# EAGLE design source_eagle (EAGLE 6.4)
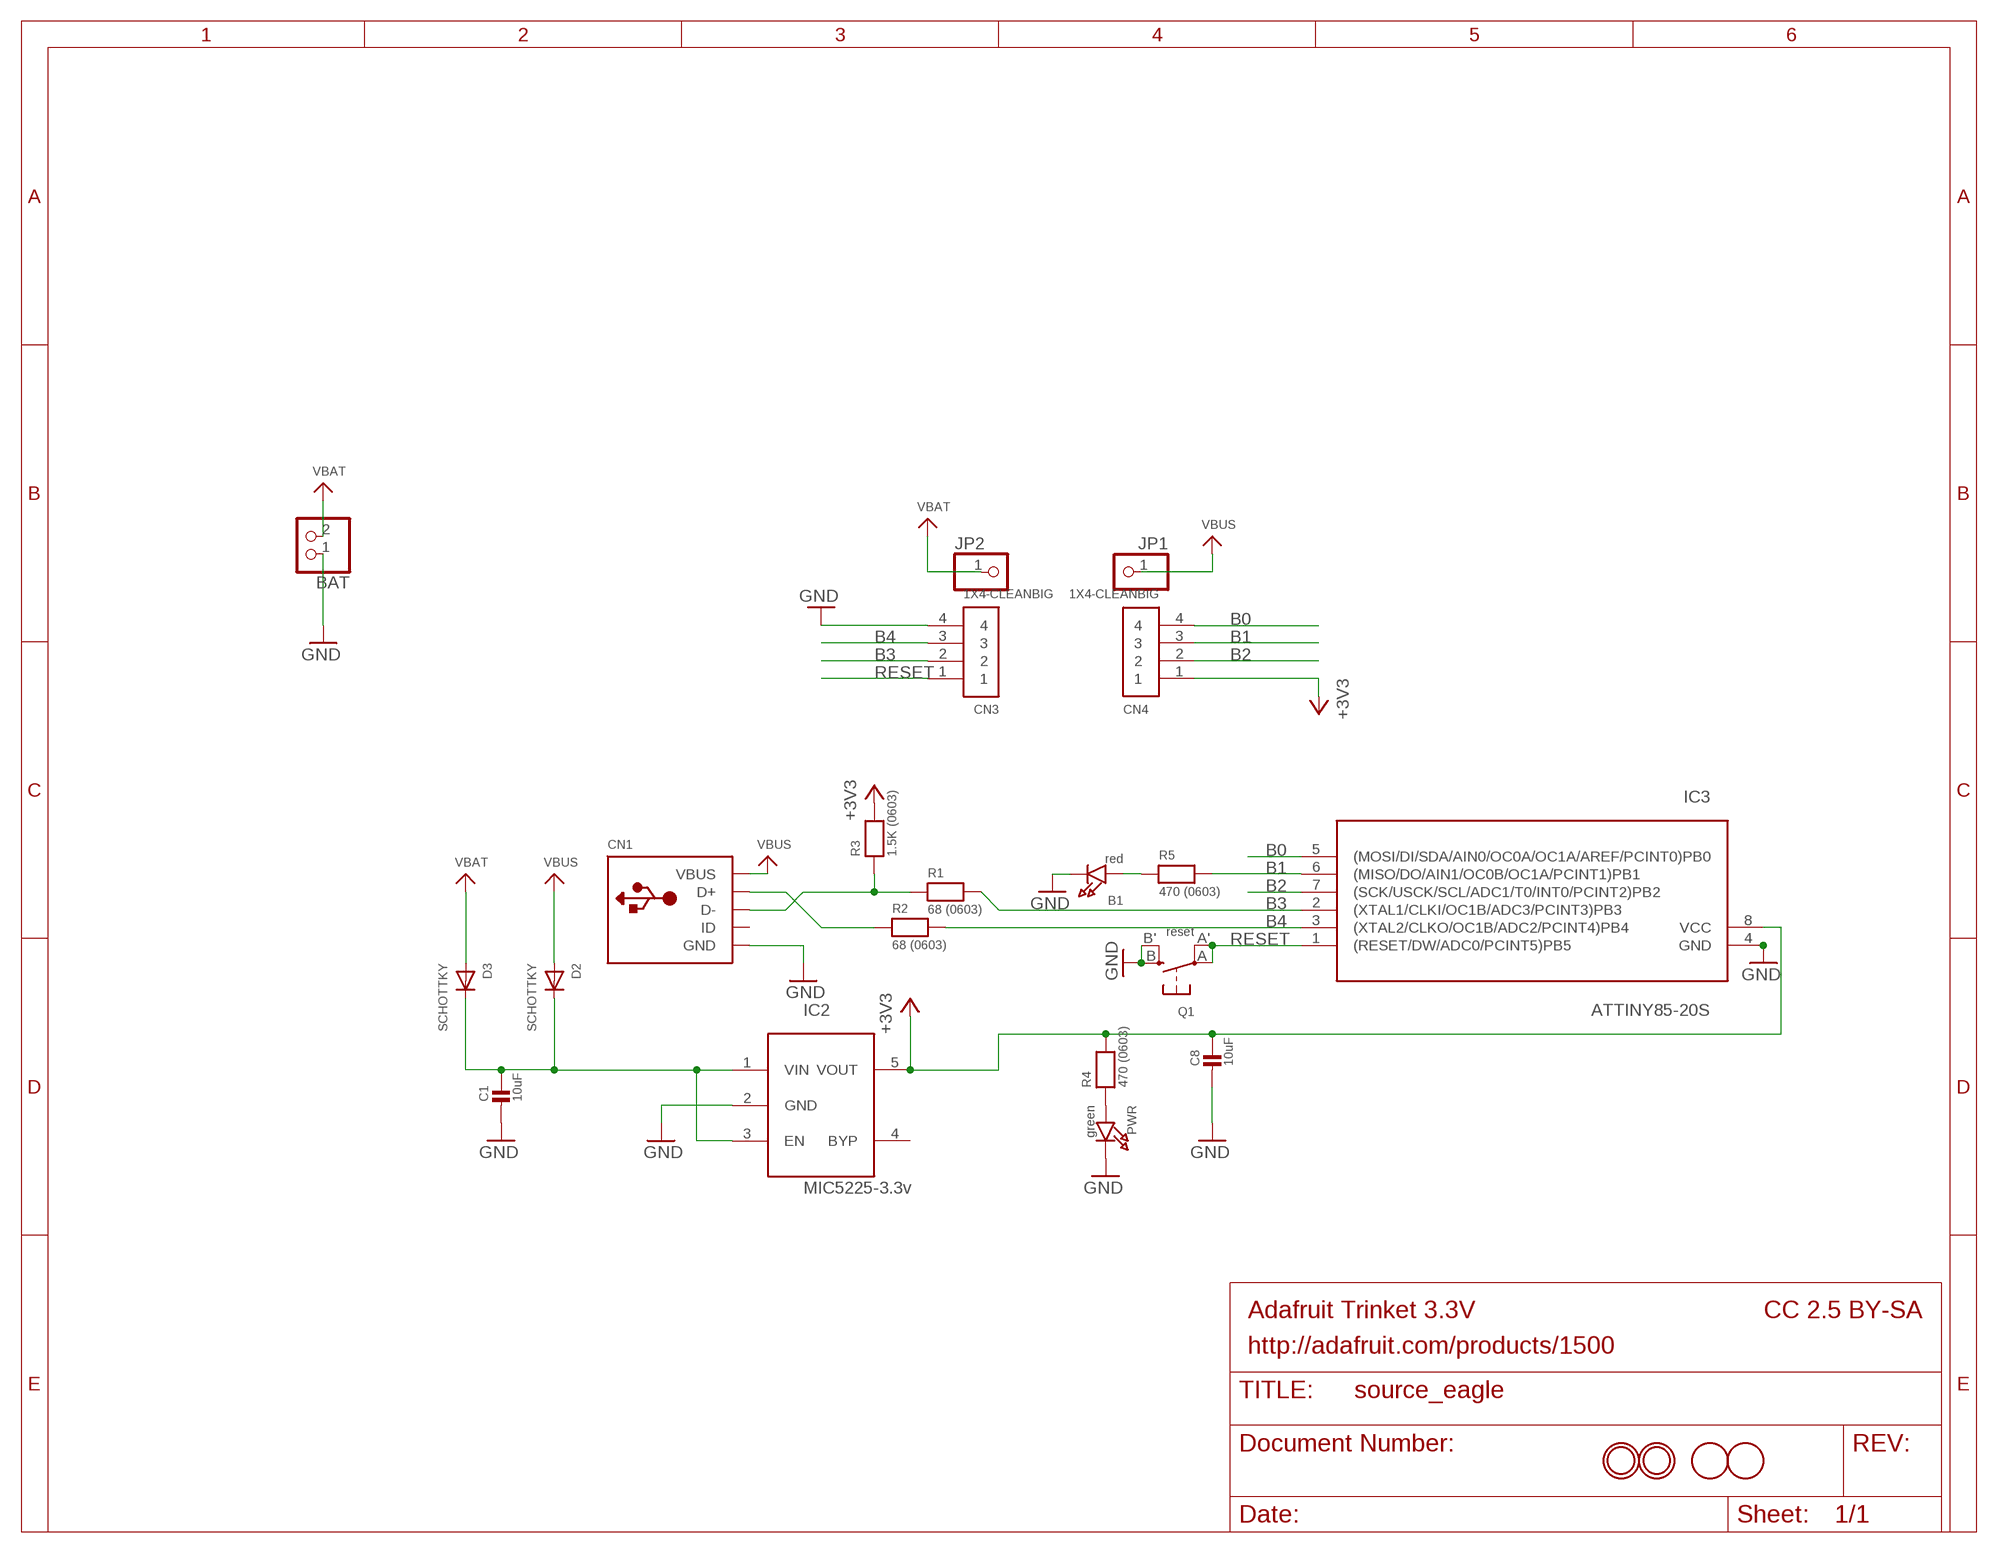
[diagram p0: schematic, sheet 1]

## Parts
B1  red  LED0805_NOOUTLINE  [CHIPLED_0805_NOOUTLINE]
BAT  CON_JST_PH_2PIN  [JSTPH2]
C1  10uF  CAP_CERAMIC0805-NOOUTLINE  [0805-NO]
C8  10uF  CAP_CERAMIC0805-NOOUTLINE  [0805-NO]
CN1  USBMINIB  [USB-MINIB]
CN3  1X4-CLEANBIG  [1X04-CLEANBIG]
CN4  1X4-CLEANBIG  [1X04-CLEANBIG]
D2  SCHOTTKY  DIODE_SOD-123FL  [SOD-123FL]
D3  SCHOTTKY  DIODE_SOD-123FL  [SOD-123FL]
IC2  MIC5225-3.3v  LP298XS  [SOT23-5L]
IC3  ATTINY85-20S  ATTINY85V-10S  [SOIC8]
JP1  PINHD-1X1CB  [1X01-CLEANBIG]
JP2  PINHD-1X1CB  [1X01-CLEANBIG]
PWR  green  LED0805_NOOUTLINE  [CHIPLED_0805_NOOUTLINE]
Q1  reset  SWITCH_TACT_SMT4.6X2.8  [BTN_KMR2_4.6X2.8]
R1  68 (0603)  RESISTOR_0603_NOOUT  [0603-NO]
R2  68 (0603)  RESISTOR_0603_NOOUT  [0603-NO]
R3  1.5K (0603)  RESISTOR_0603_NOOUT  [0603-NO]
R4  470 (0603)  RESISTOR_0603_NOOUT  [0603-NO]
R5  470 (0603)  RESISTOR_0603_NOOUT  [0603-NO]
U$1  FIDUCIAL  [FIDUCIAL_1MM]
U$6  FIDUCIAL  [FIDUCIAL_1MM]
U$8  MOUNTINGHOLE2.0  [MOUNTINGHOLE_2.0_PLATED]
U$9  MOUNTINGHOLE2.0  [MOUNTINGHOLE_2.0_PLATED]

## Nets
+3V3: C8.1 CN4.1 IC2.5(VOUT) IC3.8(VCC) R3.2 R4.2
B0: CN4.4 IC3.5((MOSI/DI/SDA/AIN0/OC0A/OC1A/AREF/PCINT0)PB0)
B1: CN4.3 IC3.6((MISO/DO/AIN1/OC0B/OC1A/PCINT1)PB1) R5.2
B2: CN4.2 IC3.7((SCK/USCK/SCL/ADC1/T0/INT0/PCINT2)PB2)
B3: CN3.2 IC3.2((XTAL1/CLKI/OC1B/ADC3/PCINT3)PB3) R1.2
B4: CN3.3 IC3.3((XTAL2/CLKO/OC1B/ADC2/PCINT4)PB4) R2.2
D+: CN1.D+ R2.1
D-: CN1.D- R1.1 R3.1
GND: B1.C BAT.1 C1.2 C8.2 CN1.GND CN1.GND1(GND) CN1.GND2(GND) CN1.GND3(GND) CN1.GND4(GND) CN3.4 IC2.2(GND) IC3.4(GND) PWR.C Q1.B'(S1) Q1.B(S)
N$1: B1.A R5.1
N$6: PWR.A R4.1
N$7: C1.1 D2.C D3.C IC2.1(VIN) IC2.3(EN)
RESET: CN3.1 IC3.1((RESET/DW/ADC0/PCINT5)PB5) Q1.A'(P1) Q1.A(P)
VBAT: BAT.2 D3.A JP2.1
VBUS: CN1.VBUS D2.A JP1.1
Unconnected: CN1.ID IC2.4(BYP)

## Notes on the sheet
- Adafruit Trinket 3.3V | CC 2.5 BY-SA
- http://adafruit.com/products/1500

## Library data of the parts
B1 PWR = microbuilder:LED: LED 0603 - 0603 Surface Mount Package 2mA: Green LED - Low Power (3.9mcd, 2ma, 1.7Vf) - Digikey: 475-2709-2-ND Orange LED - Low Power (9.8mcd, 2ma, 1.8Vf) - Digikey: 475-1194-2-ND Red LED - Low Power (5mcd, 2ma, 1.8Vf) - Digikey: 475-1195-2-ND Yellow LED - Low Power (7mcd, 2ma, 1.8Vf) - Digikey: 475-1196-2-ND 5mA: Blue LED - Low Power (17mcd, 5ma, 2.9Vf) - Digikey: LNJ937W8CRACT-ND 0805 - 0805 Surface Mount Package 2mA: Red LED (8.8mcd, 2mA, 1.8Vf, Clear) - Low Power [Digikey: 475-2510-1-ND] Green LED (5mcd, 2mA, 1.8Vf, Clear) - Low Power [Digikey: 475-2730-1-ND] Yellow LED (11.3mcd, 2mA, 1.8Vf, Clear) - Low Power [Digikey: 475-2555-1-ND] 20mA: Red LED (104mcd, 20mA, Diffused) - LS R976 [Digikey: 475-1278-6-ND] Red LED (12mcd, 20mA, 2.0Vf, Clear) - APT2012EC [Digikey: 754-1128-1-ND] Green LED (15mcd, 20mA, 2.2Vf, Clear) - APT2012GC [Digikey: 754-1131-1-ND] Orange LED (160mcd, 20mA, 2.1Vf, Clear) - APT2012SECK [Digikey: 754-1130-1-ND] 1206 - 1206 Surface Mount Package Green LED (26mcd, 20mA, Diffused) - LG N971 [Digikey: 475-1407-6-ND] Red LED (15mcd, 20mA, Diffused) - LH N974 [Digikey: 475-1416-6-ND] Cree - Cree High-Power Surface Mount LEDs XPEBWT-L1-0000-00D50 - White 111lm 350mA 2.9Vf 6200K 110° XTEAWT-00-0000-00000LEE3 - White 114lm 350mA 2.85Vf 5000K 115° Everlight - Everlight 45-21 Series Surface Mount LEDs 45-21/QK2C-B2832AC2CB2/2T - Warm White 2000mcd 20mA 3.25Vf 3050K 120° 45-21/LK2C-B38452C4CB2/2T - Nuetral White 2000mcd 20mA 3.25Vf 4150K 120° 45-21/LK2C-B50634C6CB2/2T - Cold White 2200mcd 20mA 3.25Vf 5650K 120° PLCC2 Reverse Mount LS T77K-J1L2-1-0-2-R18-Z - Red 11.25mcd 2mA 1.8Vf 630nm 120° LO T77K-L1M2-24-Z - Orange 19.6mcd 2mA 1.8Vf 606nm 120° LY T77K-K2M1-26-Z - Yellow 15.7mcd 2mA 1.8Vf 587nm 120°
BAT = microbuilder:CON_JST_PH_2PIN: JST 2-Pin Right-Angle Connector PH-Series - 4UConnector: 17311 SH-Series - 4UConnector: 07278
C1 C8 = microbuilder:CAP_CERAMIC: Ceramic Capacitors For new designs, use the packages preceded by an '_' character since they are more reliable: The following footprints should be used on most boards: _0402 - Standard footprint for regular board layouts _0603 - Standard footprint for regular board layouts _0805 - Standard footprint for regular board layouts For extremely tight-pitch boards where space is at a premium, the following 'micro-pitch' footprints can be used (smaller pads, no silkscreen outline, etc.): _0402MP - Micro-pitch footprint for very dense/compact boards _0603MP - Micro-pitch footprint for very dense/compact boards _0805MP - Micro-pitch footprint for very dense/compact boards Commonly Stocked Parts 0402 - 0402 Surface Mount Capacitors 16pF 50V 5% [Digikey: 445-4899-2-ND] 18pF 50V 5% [Digikey: 490-1281-2-ND] 22pF 50V 5% [Digikey: 490-1283-2-ND] 68pF 50V 5% [Digikey: 490-1289-2-ND] 0.1uF 10V 10% [Digikey: 490-1318-2-ND] 1.0uF 6.3V 10% [Digikey: 490-1320-2-ND] 0603 - 0603 Surface Mount Capacitors 16 pF 50V 5% [Digikey: 445-5051-2-ND] 22 pF 50V [Digikey: PCC220ACVTR-ND] 33 pF 50V 5% [Digikey: 490-1415-1-ND] 56pF 50V 5% [Digikey: 490-1421-1-ND] 220pF 50V 5% [Digikey: 445-1285-1-ND] 680 pF 50V 2200 pF 50V 5% C0G [Digikey: 445-1297-1-ND] 5600 pF 100V 5% X7R [Digikey: 478-3711-1-ND] 0.1 µF 25V 10% [Digikey: PCC2277TR-ND] 0.22 µF 16V 10% X7R [Digikey: 445-1318-1-ND] 1.0 µF 25V 10% [Digikey: 445-5146-2-ND] 0603 - RF Specific 3pF 250V +/-0.1pF RF [Digikey: 712-1347-1-ND] 18 pF 250V 5% [Digikey: 478-3505-1-ND or 712-1322-1-ND] 56 pF 250V 5% C0G RF [Digikey: 490-4867-1-ND] 68 pF 250V RF [Digikey: 490-4868-1-ND] 0805 - 0805 Surface Mount Capacitors 220 pF 250V 2% RF Ceramic Capacitor [Digikey: 712-1398-1-ND] 1000 pF 50V 2% NP0 Ceramic Capacitor [Digikey: 478-3760-1-ND] 0.1 µF 25V 10% Ceramic Capacitor [Digikey: PCC1828TR-ND] 1.0 µF 16V 10% Ceramic Capacitor[Digikey: 490-1691-2-ND] 10.0 µF 10V 10% Ceramic Capacitor[Digikey: 709-1228-1-ND] 10.0 uF 16V 10% Ceramic Capacitor [Digikey: 478-5165-2-ND] 47 uF 6.3V 20% Ceramic Capacitor [Digikey: 587-1779-1-ND or 399-5506-1-ND] 1206 - 1206 Surface Mount Capacitors 47uF 10V 20% Ceramic Capacitor [Digikey: 490-5528-1-ND or 399-5508-1-ND or 445-6010-1-ND] 100uF 6.3V -20%, +80% Y5V Ceramic Capacitor (Digikey: 490-4512-1-ND, Mouser: 81-GRM31CF50J107ZE1L)
CN1 = microbuilder:USB: USB Connectors USBMINIB - Surface Mount Female Mini-B USB Connector 4UConnector: 06564
CN3 CN4 = adafruit:1X4: 4-pin connector
D2 D3 = adafruit:DIODE: Diode SMADIODE - SMA Surface Mount Package 20V 1A Schottky Diode Digikey: 641-1014-6-ND DO-1N4148 - Through Hole Small Current Diode SOD-123 20V 1 A (.5mV Vf) Schottky Diode - Digikey: MBRX120TPMSCT-ND SOD-323 10V 570mA (.38mV Vf, 3ns) Schottky Diode - Digikey: ZLLS410CT-ND SOD-523 30V 30mA Schottky Diode (RB751S-40TE61) - Digikey: RB751S-40TE61CT-ND SOT23-R/W - SOT23 Package (R = Solder Paste/Reflow Ovens, W = Hand-Soldering) BAT54Film 40V 300mA - Digikey: 497-7162-1-ND
IC2 = adafruit:LP298X
IC3 = avr:ATTINY85: MICROCONTROLLER 8 Kbytes FLASH 512 bytes EEPROM 512 bytes RAM 4-channel 10 bit ADC USI
JP1 JP2 = adafruit:PINHD-1X1: Pin header 1x1 for 0.1" spacing With round pins
Q1 = microbuilder:SWITCH_TACT_SMT: SMT Tact Switches 6x6mm - Digikey: P12940SCT-ND KMR2 (4.6x2.8mm) - Digikey: 401-1426-1-ND EVQ-PQHB55 - Light Touch, 160GF (4.5x4.5mm) - Digikey: P8090SCT-ND KMT0 - KMT021 NGJ LHS (etc.) IP68/Waterproof - Digikey: CKN10289CT-ND
R1-R5 = microbuilder:RESISTOR: Resistors For new designs, use the packages preceded by an '_' character since they are more reliable: The following footprints should be used on most boards: _0402 - Standard footprint for regular board layouts _0603 - Standard footprint for regular board layouts _0805 - Standard footprint for regular board layouts For extremely tight-pitch boards where space is at a premium, the following 'micro-pitch' footprints can be used (smaller pads, no silkscreen outline, etc.): _0402MP - Micro-pitch footprint for very dense/compact boards _0603MP - Micro-pitch footprint for very dense/compact boards _0805MP - Micro-pitch footprint for very dense/compact boards
U$1 U$6 = adafruit:FIDUCIAL: For use by pick and place machines to calibrate the vision/machine, 1mm By microbuilder.eu
U$8 U$9 = microbuilder:MOUNTINGHOLE: Mounting Hole For #2 screws (0.086"/2.18mm width, 0.094"/2.4mm hole) use 2.5mm; BOM: EXCLUDE

## Net classes
1 power: width 0.305 mm

## Board
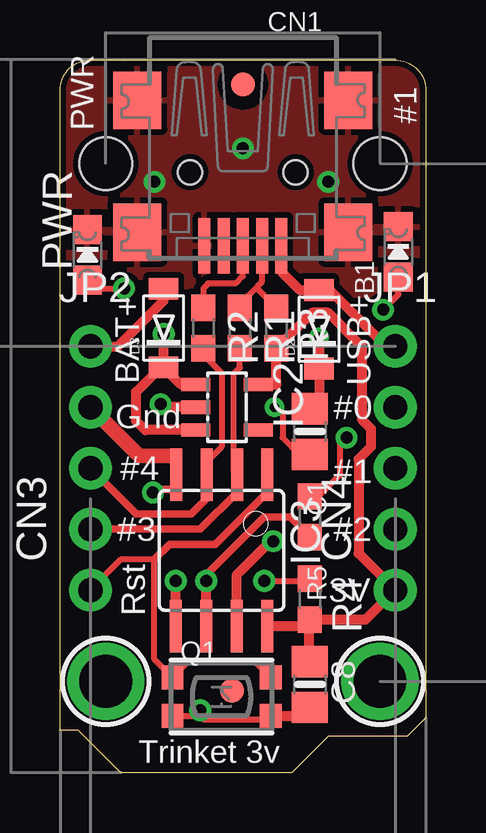
[diagram p1: board, top side]
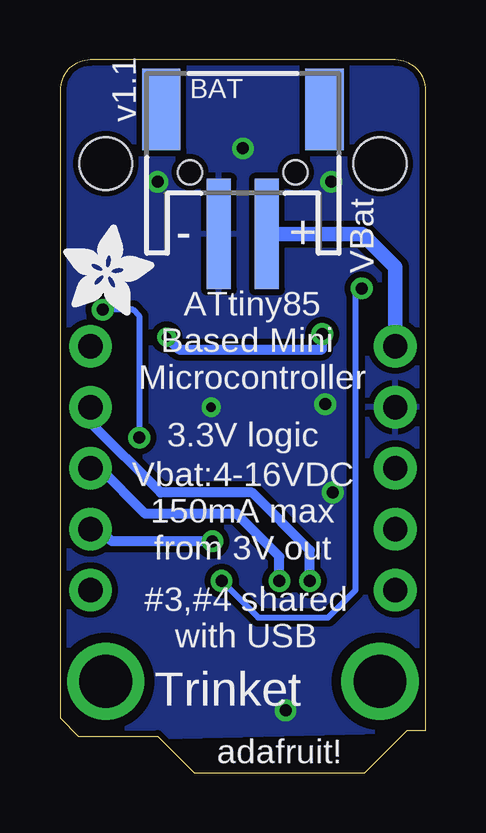
[diagram p2: board, bottom side, seen from below]

Size 15.24 x 29.72 mm. Coordinates in mm from the lower left corner, seen from the top.
Outline: 15.24,28.45 15.24,2.29 14.48,1.52 11.18,1.52 9.65,0 2.54,0 0.76,1.78 0,1.78 0,28.45 arc-90 1.27,29.72 13.97,29.72 arc-90 15.24,28.45
Copper layers (1*16): Top 0.035mm / dielectric 1.5mm / Bottom 0.035mm
Design rules "adafruit *": minimum track width 8mil, minimum drill 15.5mil, track to track 10mil, track to pad 10mil, pad to pad 10mil, via to via 10mil, smd to smd 8mil, copper to edge 10mil, drill to drill 8mil, minimum pad ring 10mil, minimum via ring 8mil, stop-mask expansion 4mil, vias tented up to drill 20mil, thermal gap 10mil
Holes 2.2 mm at 1.91,25.4 13.34,25.4

### Footprints (pad centres in the part's own frame; a part is rotated, then mirrored left to right if it is on the bottom)
CHIPLED_0805_NOOUTLINE = smd 1.2 x 1.2: A 0,-1.05; C 0,1.05
JSTPH2 = smd 1 x 4.6: 1 -1,-3.7; 2 1,-3.7 | smd 1.6 x 3.4: NC1 -3.4,1.5; NC2 3.4,1.5
0805-NO = smd 1.3 x 1.5: 1 -0.95,0; 2 0.95,0
USB-MINIB = smd 0.5 x 2.308: D+ 0,4.064; D- -0.8,4.064; GND 1.6,4.064; ID 0.8,4.064; VBUS -1.6,4.064 | smd 2 x 2.4: GND1 -4.4,-2; GND2 -4.4,3.5; GND3 4.4,3.5; GND4 4.4,-2 | hole 1: -2.2,1; 2.2,1
1X04-CLEANBIG = drill 1.016 pad 1.778: 1 -3.81,0; 2 -1.27,0; 3 1.27,0; 4 3.81,0
SOD-123FL = smd 0.91 x 1.22: A 1.637,0; C -1.637,0
SOT23-5L = smd 0.55 x 1.2: 1 -0.95,-1.3; 2 0,-1.3; 3 0.95,-1.3; 4 0.95,1.3; 5 -0.95,1.3
SOIC8 = smd 0.5 x 2.2: 1 -1.905,-3.154; 2 -0.645,-3.154; 3 0.625,-3.154; 4 1.895,-3.154; 5 1.905,3.154; 6 0.635,3.154; 7 -0.635,3.154; 8 -1.905,3.154
1X01-CLEANBIG = drill 1.016 pad 1.778: 1 0,0
BTN_KMR2_4.6X2.8 = smd 0.9 x 1: A 2.05,0.8; A' -2.05,0.8; B 2.05,-0.8; B' -2.05,-0.8
0603-NO = smd 1.1 x 1: 1 -0.85,0; 2 0.85,0
FIDUCIAL_1MM = smd 1 x 1: 1 0,0
MOUNTINGHOLE_2.0_PLATED = drill 2.2 pad 3: P$1 0,0

### Placement (x,y rotation side)
B1  14.1,21.72 0 top
BAT  7.62,26.16 0 bottom
C1  10.41,14.22 270 top
C8  10.41,3.68 270 top
CN1  7.62,26.04 180 top
CN3  1.27,11.43 90 top
CN4  13.97,11.43 90 top
D2  10.79,18.49 90 top
D3  4.32,18.54 90 top
IC2  6.96,15.24 270 top
IC3  6.73,9.27 180 top
JP1  13.97,17.78 0 top
JP2  1.27,17.78 0 top
PWR  1.14,21.59 0 top
Q1  6.73,3.18 0 top
R1  7.49,18.54 270 top
R2  5.97,18.54 270 top
R3  9.02,18.54 270 top
R4  10.41,7.24 270 top
R5  10.41,10.67 270 top
U$1  7.62,28.7 0 top
U$5  [ADAFRUIT_3.5MM]  15.11,19.05 0 bottom
U$6  7.18,3.43 0 top
U$8  1.91,3.81 0 top
U$9  13.34,3.81 0 top

### Tracks (layer width: path | path; a pad name or v marks a point on that pad's centre or on a via)
+3V3
  Top 0.254: 10.37,6.12 10.41,6.16 R4.2
  Top 0.406: IC3.8 10.37,6.12 10.37,4.68 C8.1 | IC2.5 9.02,16.19 R3.2 10.5,19.18 11.18,19.18 12.57,17.78 12.57,14.73 12.95,14.35 12.95,13.59 12.45,13.08 12.45,9.14 CN4.1 12.74,6.39 R4.2
B0  (via drill 0.5)
  Top 0.406: IC3.5 v4.83,8
  Bottom 0.406: v4.83,8 4.83,9.27 7.24,11.68 11.05,11.68 13.97,14.61 CN4.4 13.97,15.11
B1  (via drill 0.5)
  Top 0.305: v6.1,8 6.1,8.26 8.51,10.67 9.59,10.67 10.41,9.85 R5.2
  Top 0.406: IC3.6 v6.1,8
  Bottom 0.406: v6.1,8 6.1,9.02 7.87,10.8 11.68,10.8 13.59,12.7 CN4.3
B2  (via drill 0.5)
  Top 0.406: IC3.7 7.37,8.26 8.76,9.65 v8.89,9.65
  Bottom 0.406: v8.89,9.65 13.08,9.65 13.59,10.16 CN4.2
B3
  Top 0.254: 7.38,11.69 IC3.2 7.24,12.56 7.24,16.64 7.49,16.89 R1.2
  Top 0.305: 7.38,11.69 5.84,10.16 CN3.2
B4
  Top 0.254: R2.2 5.97,17.44 6.73,16.68 6.73,13.59 6.11,12.96 IC3.3
  Top 0.305: IC3.3 6.11,11.44 5.46,10.8 3.17,10.8 CN3.3
D+
  Top 0.254: R2.1 5.97,20.19 6.17,20.4 7.32,20.4 7.62,20.7 CN1.D+
D-
  Top 0.254: 8.26,20.32 8.42,20.48 CN1.D- | 8.26,20.32 7.49,19.56 R1.1 | R3.1 8.26,20.15 8.26,20.32
GND  (via drill 0.39, 0.5)
  Top 0.254: Q1.B' 5.84,2.38 | 5.84,2.38 6,2.22 8.64,2.22 8.64,2.23 Q1.B | v5.84,2.6 5.84,2.38 | v8.94,15.24 9.27,14.91 9.27,13.97 9.97,13.27 C1.2
  Top 0.305: 4.84,12.18 IC3.4 4.84,13.07 4.7,13.21 | 4.84,11.82 4.01,11.82 v3.87,11.68
  Top 0.406: Q1.B 10.06,2.38 C8.2 | 4.84,12.18 4.84,11.82 | IC2.2 4.32,15.24 v4.19,15.37
  Top 0.61: CN3.4 3.3,13.21 4.7,13.21
  other vias: 3.94,24.64 11.18,24.64 7.62,26.04
  pour Bottom: -0.25,29.84 0,1.78 15.24,1.4 14.99,29.46
  pour Top: 0.25,29.84 0.25,19.94 15.11,19.94 15.11,29.84
N$1  (via drill 0.5)
  Top 0.254: v11.94,13.97 11.68,13.72 11.68,12.45 10.76,11.52 R5.1 | B1.A 14.1,19.94 v13.46,19.3
  Bottom 0.254: v11.94,13.97 11.94,19.05 12.19,19.3 v13.46,19.3
N$6  (via drill 0.5)
  Top 0.254: PWR.A 1.18,20.54 1.52,20.19 v2.67,20.19 | v8.51,8 10.33,8 R4.1
  Bottom 0.254: v8.51,8 6.99,6.48 4.06,6.48 2.92,7.62 2.92,19.94 v2.67,20.19
N$7  (via drill 0.39, 0.5)
  Top 0.406: IC2.3 3.56,14.29 3.17,14.67 3.17,15.88 4.2,16.9 D3.C | C1.1 10.79,15.55 D2.C v10.79,18.16 | IC2.1 5.03,16.19 D3.C | D3.C v4.32,18.29
  Bottom 0.406: v4.32,18.29 4.32,17.65 10.29,17.65 v10.79,18.16
RESET
  Top 0.254: 1.42,7.62 CN3.1 2.54,8.89 3.94,8.89 3.94,4.72 Q1.A' 5.34,4.63 8.12,4.63 Q1.A
  Top 0.305: 3.94,8.89 4.57,9.53 6.48,9.53 8.64,11.68 IC3.1
VBAT
  Top 0.406: JP2.1 2.41,17.78 4.32,19.69 D3.A
  Bottom 0.61: BAT.2 2.65,22.46 1.27,21.08 JP2.1
VBUS
  Top 0.406: CN1.VBUS 9.22,20.9 9.99,20.13 D2.A 11.24,20.13 13.59,17.78 JP1.1

### Text on the board
tPlace: PWR | #1 | BAT+ | USB+ | Gnd | #0 | #4 | #1 | #3 | #2 | Rst | 3V | Trinket 3v
bPlace: v1.1 | + | - | VBat | ATtiny85 / Based Mini / Microcontroller | 3.3V logic | Vbat:4-16VDC / 150mA max / from 3V out | #3,#4 shared / with USB | Trinket | adafruit!